# Altium schematic sheet Sheet1.SchDoc
size A4
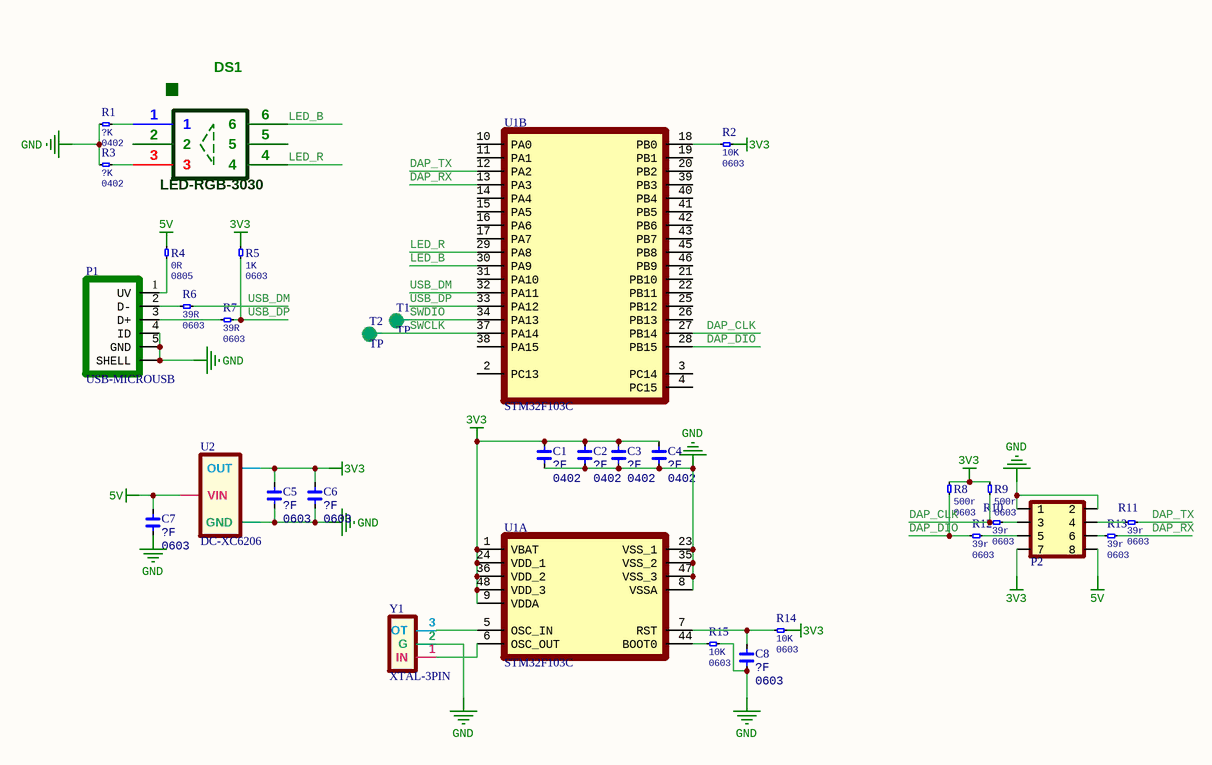
[diagram p0: Sheet1.SchDoc]

## Parts
C1  ?F  Type: 0402  [CAP 0402/1005]
C2  ?F  Type: 0402  [CAP 0402/1005]
C3  ?F  Type: 0402  [CAP 0402/1005]
C4  ?F  Type: 0402  [CAP 0402/1005]
C5  ?F  Type: 0603  [cap_0603]
C6  ?F  Type: 0603  [cap_0603]
C7  ?F  Type: 0603  [cap_0603]
C8  ?F  Type: 0603  [CAP 0603/1608]
DS1  LED-RGB-3030  [LED-RGB-PLCC6(3030)]
P1  USB-MICROUSB  [USB_Micro-AB]
P2  HDR2x4_2.54  [HDR2X4_2.54_180H]  (value not drawn)
R1  Type: 0402  [RES 0402/1005]  (hidden comment: ?K)
R2  Type: 0603  [RES_0603]  (hidden comment: 10K)
R3  Type: 0402  [RES 0402/1005]  (hidden comment: ?K)
R4  Type: 0805  [RES 0805/2012]  (hidden comment: 0R)
R5  Type: 0603  [RES_0603]  (hidden comment: 1K)
R6  Type: 0603  [RES_0603]  (hidden comment: 39R)
R7  Type: 0603  [RES_0603]  (hidden comment: 39R)
R8  Type: 0603  [RES 0603/1608]  (hidden comment: 500r)
R9  Type: 0603  [RES 0603/1608]  (hidden comment: 500r)
R10  Type: 0603  [RES 0603/1608]  (hidden comment: 39r)
R11  Type: 0603  [RES 0603/1608]  (hidden comment: 39r)
R12  Type: 0603  [RES 0603/1608]  (hidden comment: 39r)
R13  Type: 0603  [RES 0603/1608]  (hidden comment: 39r)
R14  Type: 0603  [RES_0603]  (hidden comment: 10K)
R15  Type: 0603  [RES_0603]  (hidden comment: 10K)
T1  TP  [TP]
T2  TP  [TP]
U1  STM32F103C  [ST LQFP-48 7x7MM]  (parts A,B of 2)
U2  DC-XC6206  [XC6206]
Y1  XTAL-3PIN  [XTAL-3PIN]

## Nets
3V3: C1.2 C2.2 C3.2 C4.2 C5.2 C6.2 P2.7 R2.2 R5.2 R8.2 R9.2 R14.2 U1.1(VBAT) U1.9(VDDA) U1.24(VDD_1) U1.36(VDD_2) U1.48(VDD_3) U2.3(OUT)
5V: C7.2 P2.8 R4.2 U2.1(VIN)
GND: C1.1 C2.1 C3.1 C4.1 C5.1 C6.1 C7.1 C8.1 P1.0(SHELL) P1.4(ID) P1.5(GND) P2.1 P2.2 R1.1 R3.1 R15.2 U1.8(VSSA) U1.23(VSS_1) U1.35(VSS_2) U1.47(VSS_3) U2.2(GND) Y1.2(G)
DAP_CLK: R9.1 R10.1 U1.27(PB14)
DAP_DIO: R8.1 R12.1 U1.28(PB15)
DAP_RX: R13.2 U1.13(PA3)
DAP_TX: R11.2 U1.12(PA2)
LED_B: DS1.6 U1.30(PA9)
LED_R: DS1.4 U1.29(PA8)
SWCLK: T2.1 U1.37(PA14)
SWDIO: T1.1 U1.34(PA13)
USB_DM: R6.2 U1.32(PA11)
USB_DP: R5.1 R7.2 U1.33(PA12)
NetC8_2: C8.2 R14.1 U1.7(RST)
NetDS1_1: DS1.1 R1.2
NetDS1_3: DS1.3 R3.2
NetP1_1: P1.1(UV) R4.1
NetP1_2: P1.2(D-) R6.1
NetP1_3: P1.3(D+) R7.1
NetP2_3: P2.3 R10.2
NetP2_4: P2.4 R11.1
NetP2_5: P2.5 R12.2
NetP2_6: P2.6 R13.1
NetR2_1: R2.1 U1.18(PB0)
NetR15_1: R15.1 U1.44(BOOT0)
NetU1_5: U1.5(OSC_IN) Y1.3(OT)
NetU1_6: U1.6(OSC_OUT) Y1.1(IN)

Not connected (* = marked no-connect by the designer): DS1 2 5; U1 2(PC13) 3(PC14) 4(PC15) 10(PA0) 11(PA1) 14(PA4) 15(PA5) 16(PA6) 17(PA7) 19(PB1) 20(PB2) 21(PB10) 22(PB11) 25(PB12) 26(PB13) 31(PA10) 38(PA15) 39(PB3) 40(PB4) 41(PB5) 42(PB6) 43(PB7) 45(PB8) 46(PB9)

## Notes on the sheet
- (in symbol LED-RGB-3030) .

## Library data of the parts
C1-C4 = Cap_0402: Capacitor
C5-C8 = Cap_0603: Capacitor
P2 = HDR2x4_2.54: Header
R1 R3 = Res_0402: Resistor; Value: ?K
R2 R5-R15 = Res_0603: Resistor
  R2 R14 R15: Value: 10K
  R5: Value: 1K
  R6 R7: Value: 39R
  R8 R9: Value: 500r
  R10-R13: Value: 39r
R4 = Res_0805: Resistor; Value: 0R
U1 = STM32F103C: MCU; Type: LQFP48 P0.5